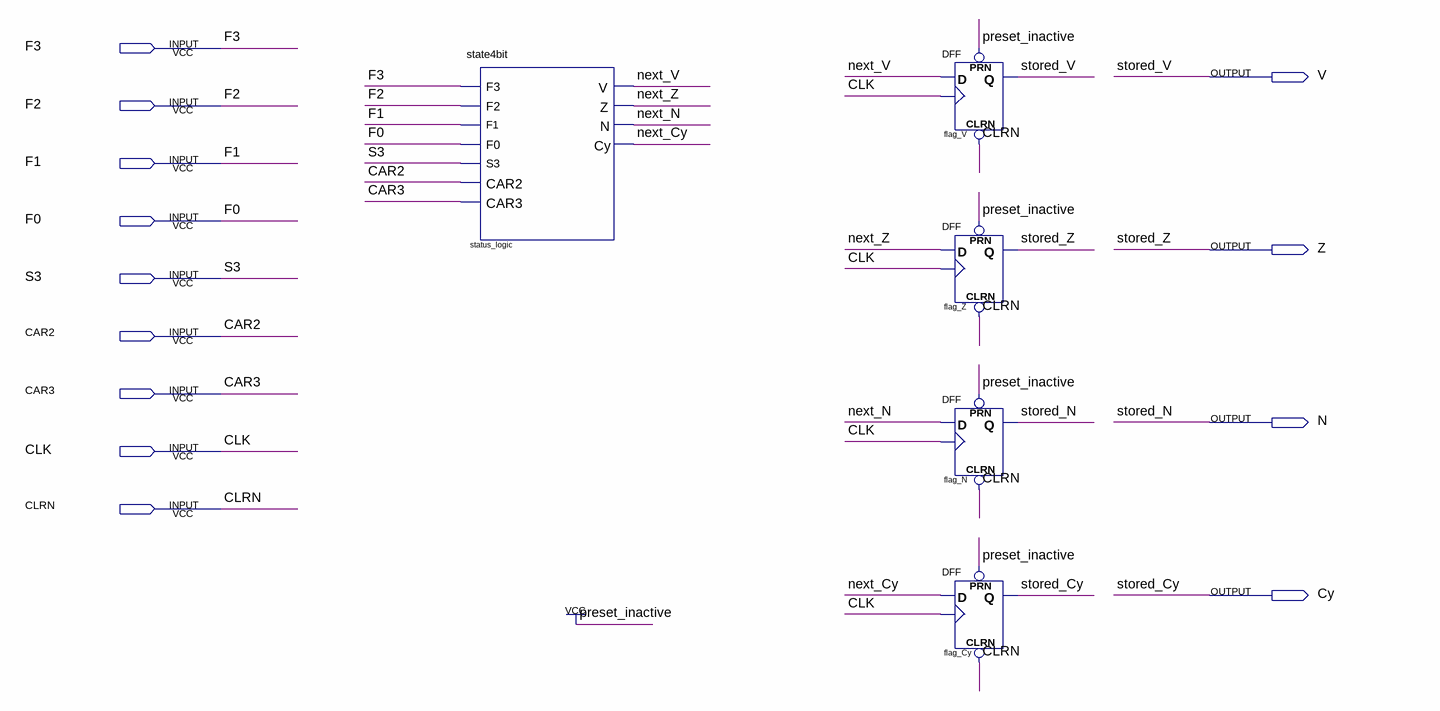
[diagram p0: schematic sheet]
// Quartus schematic state4bit_register.bdf as structural Verilog: 5 symbols, 13 pins
module state4bit_register (
  input  F3,
  input  F2,
  input  F1,
  input  F0,
  input  S3,
  input  CAR2,
  input  CAR3,
  input  CLK,
  input  CLRN,
  output V,
  output Z,
  output N,
  output Cy
);

  wire next_Cy, next_N, next_V, next_Z;

  state4bit status_logic (
    .F3(F3), .F2(F2), .F1(F1), .F0(F0), .S3(S3), .CAR2(CAR2), .CAR3(CAR3), .V(next_V), .Z(next_Z),
    .N(next_N), .Cy(next_Cy));
  DFF flag_V (.CLRN(CLRN), .CLK(CLK), .D(next_V), .PRN(1'b1), .Q(V));
  DFF flag_Z (.CLRN(CLRN), .CLK(CLK), .D(next_Z), .PRN(1'b1), .Q(Z));
  DFF flag_N (.CLRN(CLRN), .CLK(CLK), .D(next_N), .PRN(1'b1), .Q(N));
  DFF flag_Cy (.CLRN(CLRN), .CLK(CLK), .D(next_Cy), .PRN(1'b1), .Q(Cy));

  // Other names for the same wires on the sheet: stored_Cy = Cy; stored_N = N; stored_V = V; stored_Z = Z
endmodule
